# Altium schematic sheet STM32_Karti_Ve_Bağlantilari.SchDoc
size A4; SheetNumber: 2; SheetTotal: 6
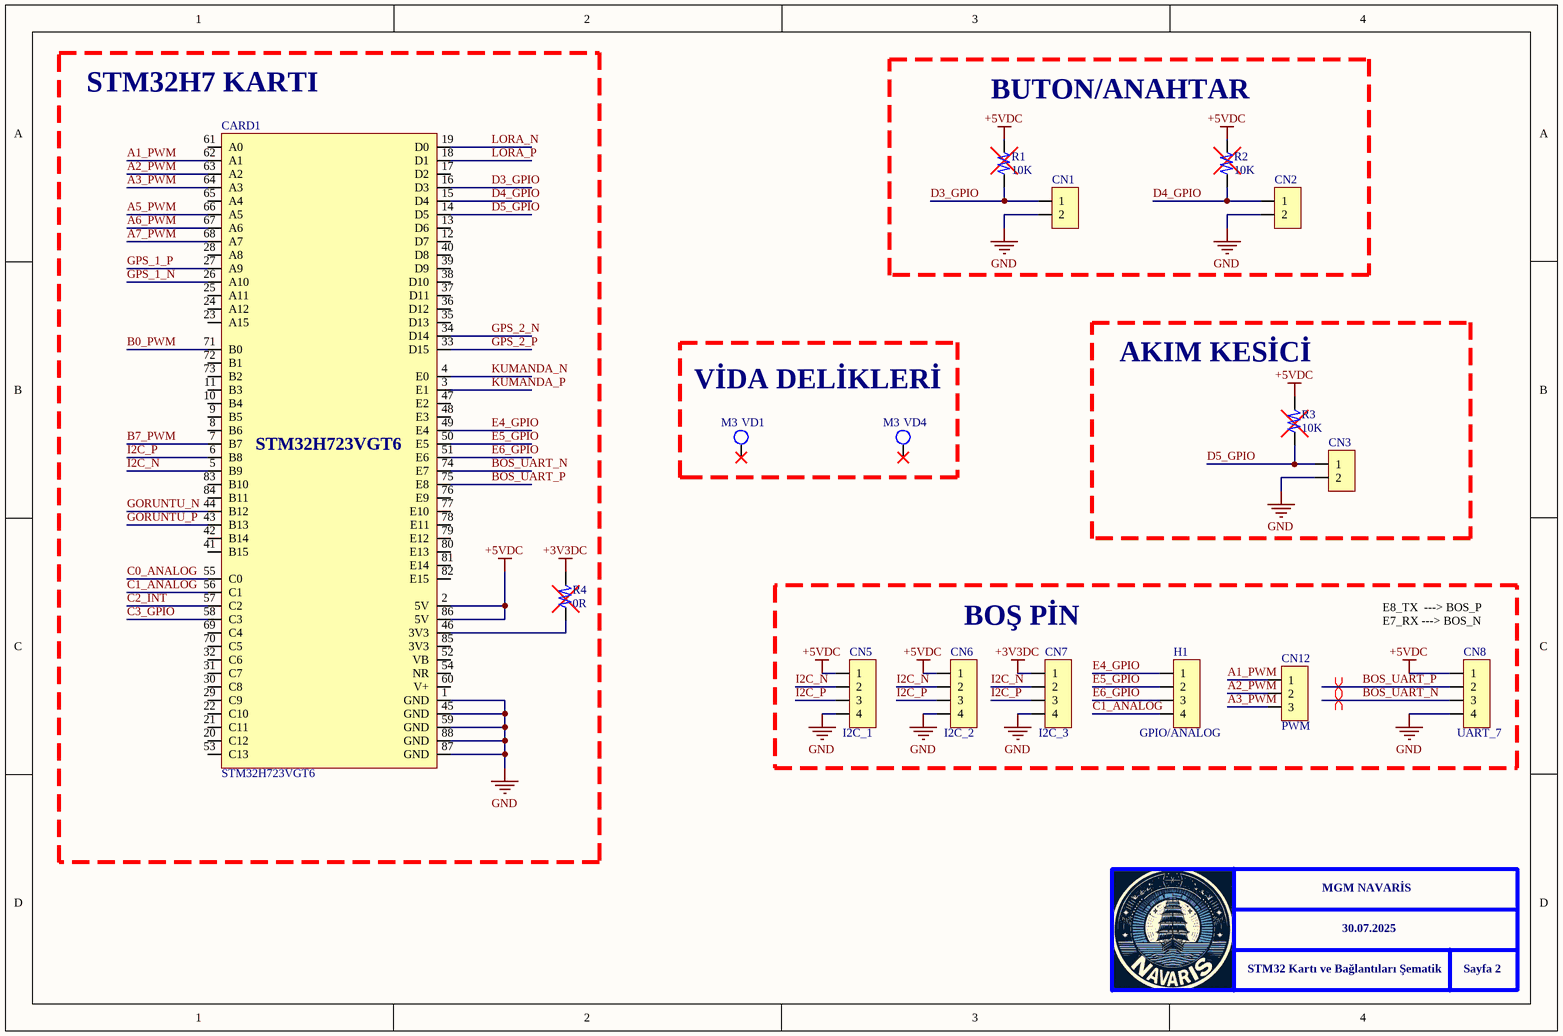
[diagram p0: STM32_Karti_Ve_Bağlantilari.SchDoc]

## Parts
CARD1  STM32H723VGT6  [STM32H723VGT6_gelistirme_karti]
CN1  Güvenlik Anahtarı  [2_Pin_JST_Male]  (value not drawn)
CN2  Güvenlik Anahtarı  [2_Pin_JST_Male]  (value not drawn)
CN3  Güvenlik Anahtarı  [2_Pin_JST_Male]  (value not drawn)
CN5  I2C_1  [4_Pin_JST_Male]
CN6  I2C_2  [4_Pin_JST_Male]
CN7  I2C_3  [4_Pin_JST_Male]
CN8  UART_7  [4_Pin_JST_Male]
CN12  PWM  [3_Pin_JST_Male]
H1  GPIO/ANALOG  [4_pin_header_2.54mm_FEMALE]
R1  10K  [1206_RES]
R2  10K  [1206_RES]
R3  10K  [1206_RES]
R4  0R  [1206_RES]
VD1  M3  [Vida_Deliği]
VD4  M3  [Vida_Deliği]

## Blocks framed on the sheet
STM32H7 KARTI: CARD1 R4
AKIM KESİCİ: CN3 R3
BOŞ PİN: CN5-CN8 CN12 H1

## Nets
+3V3DC: CN7.1 R4.2
+5VDC: CARD1.2(5V) CARD1.86(5V) CN5.1 CN6.1 CN8.1 R1.2 R2.2 R3.2
GND: CARD1.1(GND) CARD1.45(GND) CARD1.59(GND) CARD1.87(GND) CARD1.88(GND) CN1.2 CN2.2 CN3.2 CN5.4 CN6.4 CN7.4 CN8.4
A1_PWM: CARD1.62(A1) CN12.1
A2_PWM: CARD1.63(A2) CN12.2
A3_PWM: CARD1.64(A3) CN12.3
A5_PWM: CARD1.66(A5)
A6_PWM: CARD1.67(A6)
A7_PWM: CARD1.68(A7)
B0_PWM: CARD1.71(B0)
B7_PWM: CARD1.7(B7)
BOS_UART_N: CARD1.74(E7) CN8.3
BOS_UART_P: CARD1.75(E8) CN8.2
C0_ANALOG: CARD1.55(C0)
C1_ANALOG: CARD1.56(C1) H1.4
C2_INT: CARD1.57(C2)
C3_GPIO: CARD1.58(C3)
D3_GPIO: CARD1.16(D3) CN1.1 R1.1
D4_GPIO: CARD1.15(D4) CN2.1 R2.1
D5_GPIO: CARD1.14(D5) CN3.1 R3.1
E4_GPIO: CARD1.49(E4) H1.1
E5_GPIO: CARD1.50(E5) H1.2
E6_GPIO: CARD1.51(E6) H1.3
GORUNTU_N: CARD1.44(B12)
GORUNTU_P: CARD1.43(B13)
GPS_1_N: CARD1.26(A10)
GPS_1_P: CARD1.27(A9)
GPS_2_N: CARD1.34(D14)
GPS_2_P: CARD1.33(D15)
I2C_N: CARD1.5(B9) CN5.2 CN6.2 CN7.2
I2C_P: CARD1.6(B8) CN5.3 CN6.3 CN7.3
KUMANDA_N: CARD1.4(E0)
KUMANDA_P: CARD1.3(E1)
LORA_N: CARD1.19(D0)
LORA_P: CARD1.18(D1)
NetCARD1_46: CARD1.46(3V3) R4.1

Not connected (* = marked no-connect by the designer): CARD1 8(B6) 9(B5) 10(B4) 11(B3) 12(D7) 13(D6) 17(D2) 20(C12) 21(C11) 22(C10) 23(A15) 24(A12) 25(A11) 28(A8) 29(C9) 30(C8) 31(C7) 32(C6) 35(D13) 36(D12) 37(D11) 38(D10) 39(D9) 40(D8) 41(B15) 42(B14) 47(E2) 48(E3) 52(VB) 53(C13) 54(NR) 60(V+) 61(A0) 65(A4) 69(C4) 70(C5) 72(B1) 73(B2) 76(E9) 77(E10) 78(E11) 79(E12) 80(E13) 81(E14) 82(E15) 83(B10) 84(B11) 85(3V3); VD1 1*; VD4 1*

## Layout directives
differential pair; net class DIFF_BOS_UART: BOS_UART_N, BOS_UART_P

## Notes on the sheet
- BUTON/ANAHTAR
- VİDA DELİKLERİ
- (near CN8) E8_TX  ---> BOS_P
  E7_RX ---> BOS_N
- MGM NAVARİS
- STM32 Kartı ve Bağlantıları Şematik
- 30.07.2025
- Sayfa 2

## Library data of the parts
CARD1 = STM32H723VGT6_gelistirme_karti_sematik
CN1-CN3 = 2_Pin_JST_Male
CN5-CN8 = 4_Pin_JST_Male
CN12 = 3_Pin_JST_Male
H1 = 4_pin_header_female
R1-R4 = 1206_RES
VD1 VD4 = Vida_Deliği